# Altium project USRP-sdr.PrjPcb
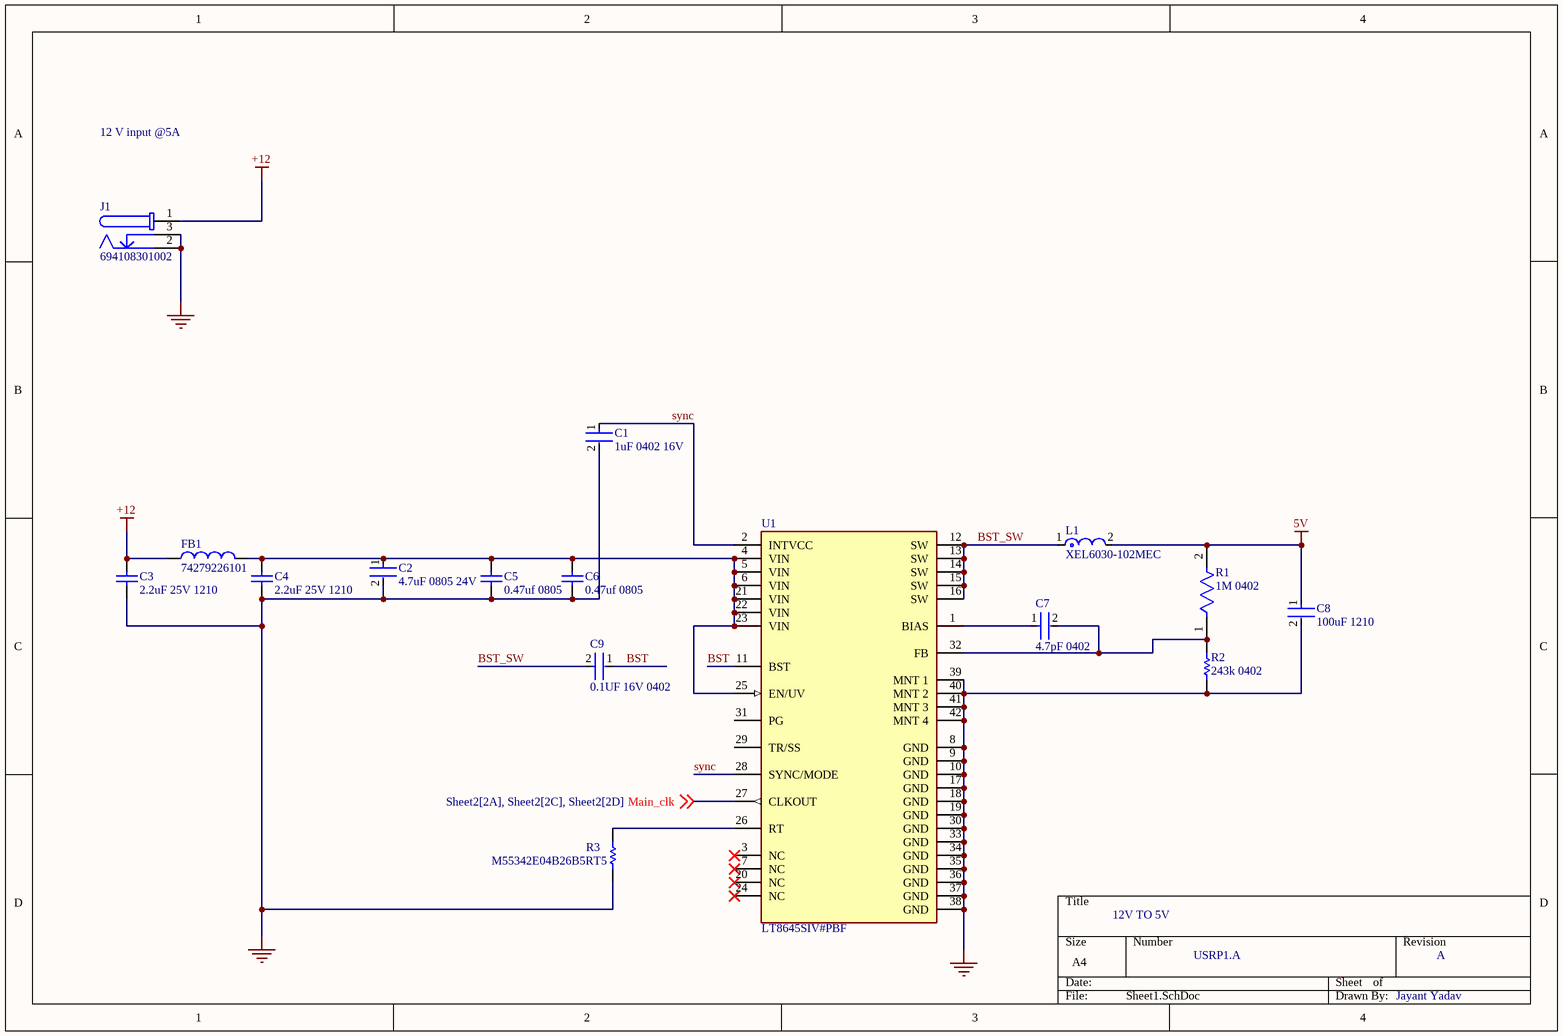
[diagram p0: Sheet1.SchDoc]
4 sheets, 190 parts. Net scope: flat (ports and power ports of the same name join across sheets).
Board file: PCB1.PcbDoc
Sheets:
  Sheet1.SchDoc
  Sheet2.SchDoc
  Sheet3.SchDoc
  Eth_2_5Gbe.SchDoc

## Sheet Sheet1.SchDoc
size A4; SheetNumber: 1; SheetTotal: 4

### Parts
C1  1uF 0402 16V  [FP-CC0402-MFG]
C2  4.7uF 0805 24V  [FP-C0805C475K3RACAUTO-MFG]
C3  2.2uF 25V 1210  [CAPC1210(3225)210_M]
C4  2.2uF 25V 1210  [CAPC1210(3225)210_M]
C5  0.47uf 0805  [CAPC2013X145X50NL20T25]
C6  0.47uf 0805  [CAPC2013X145X50NL20T25]
C7  4.7pF 0402  [FP-C0402-BB-MFG]
C8  100uF 1210  [FP-C1210C-FS-MFG]
C9  0.1UF 16V 0402  [FP-CC0402-0_05-0_55-L2_0-MFG]
FB1  74279226101  [WE-MPSB_1812_L4.5W3.2H2.3]
J1  694108301002  [694108301002]
L1  XEL6030-102MEC  [FP-XEL6030-3_1-MFG]
R1  1M 0402  [FP-MCS0402-IPC_C]
R2  243k 0402  [RESC1005X40X25NL05T05]
R3  M55342E04B26B5RT5  [RESC1005X40X25ML10T10]
U1  LT8645SIV#PBF  [FP-LQFN-32-05-08-1512-MFG]

### Nets
5V: C8.1 L1.2 R1.2
+12: C3.2 FB1.1 J1.1
GND: C1.2 C2.2 C3.1 C4.1 C5.1 C6.1 C8.2 J1.2 J1.3 R2.1 R3.1 U1.8(GND) U1.9(GND) U1.10(GND) U1.17(GND) U1.18(GND) U1.19(GND) U1.30(GND) U1.33(GND) U1.34(GND) U1.35(GND) U1.36(GND) U1.37(GND) U1.38(GND) U1.39(MNT_1) U1.40(MNT_2) U1.41(MNT_3) U1.42(MNT_4)
BST: C9.1 U1.11(BST)
BST_SW: C9.2 L1.1 U1.12(SW) U1.13(SW) U1.14(SW) U1.15(SW) U1.16(SW)
Main_clk: U1.27(CLKOUT) ; off-sheet Main_clk
sync: C1.1 U1.2(INTVCC) U1.28(SYNC/MODE)
NetC2_1: C2.1 C4.2 C5.2 C6.2 FB1.2 U1.4(VIN) U1.5(VIN) U1.6(VIN) U1.21(VIN) U1.22(VIN) U1.23(VIN) U1.25(EN/UV)
NetC7_1: C7.1 U1.1(BIAS)
NetC7_2: C7.2 R1.1 R2.2 U1.32(FB)
NetR3_2: R3.2 U1.26(RT)

Not connected (* = marked no-connect by the designer): U1 3(NC)* 7(NC)* 20(NC)* 24(NC)* 29(TR/SS) 31(PG)

### Notes on the sheet
- 12 V input @5A
- 12V TO 5V
- USRP1.A
- A
- Jayant Yadav

### Library data of the parts
C1 = CMP-03422-000064-1: CC0402 1 uF X5R 10.00% 16 V; Manufacturer: YAGEO; Manufacturer Part Number: CC0402KPX5R7BB105; Tolerance: 0.1; Automotive Grade: NA; Material: Ceramic; Temperature Coefficient: 30ppm/°C; Footprint Url: http://www.yageo.com/exep/pages/download/literatures/UPY-C_GEN_24.pdf; Temperature Characteristic: X5R; Device Class L3: Ceramic Capacitors; Category: Cap; ComponentLink2URL: http://www.yageo.com/documents/recent/UPY-GP_NP0_16V-to-50V_16.pdf; Voltage Rating: 16 V; Temperature Range Low: -55°C; Ipc Land Pattern Name: CAPC10050X50; Height: 0.55mm; Temperature: -55°C to +125°C; Automotive: No; Lead Free: Yes; Device Class L2: Capacitors; Device Class L1: Passive Components; Value: 1 uF; Temperature Range High: +125°C; Octopart: https://octopart.com/cc0402kpx5r7bb105-yageo-89998189; Capacitance: 1 uF; ComponentLink2Description: Datasheet; Package: CC0402; RoHS: TRUE
C2 = CMP-03020-034682-1: CAP CER 0805 4.7UF 25V X7R  10%; RoHS Compliant: Yes
C3 C4 = CMP-1038-02085-1: CAP 2.2uF 25V ±5% 1210 (3225 Metric) Thickness 2.05mm SMD; Case-Metric: 3225; Case-EIA: 1210; Tolerance: Â±5%; Technology: SMT; Max Thickness: 2.05 mm; Value: 2.2uF; Rated Voltage: 25 V
C5 C6 = CMP-2007-01148-1: Part Number: C0805C474K3RALTU; Manufacturer: Kemet
C7 = CMP-03020-005498-1: C0402 4.7 pF C0G 0.1 pF 50 V; Manufacturer: Kemet; Manufacturer Part Number: C0402C479B5GACAUTO; Tolerance: 0.1 pF; Temperature Coefficient: 15%; Material: Ceramic; Voltage Rating: 50 V; Temperature Range High: +125°C; Device Class L2: Capacitors; Package: C0402-BB; Temperature Range Low: -55°C; Capacitance: 4.7 pF; Category: Cap; RoHS: TRUE; ComponentLink2URL: https://content.kemet.com/datasheets/KEM_C1002_X7R_SMD.pdf; Height: 0.55mm; Lead Free: Yes; Mouser Description: Cap Ceramic 4.7pF 50V C0G 0.1pF SMD 0402 125°C T/R; Octopart: https://octopart.com/c0402c479b5gacauto-kemet-87334100; Value: 4.7 pF; Automotive: No; Device Class L3: Ceramic Capacitors; Ipc Land Pattern Name: CAPC10050X50; Temperature Characteristic: C0G; Device Class L1: Passive Components; Temperature: -55°C to +125°C; ComponentLink2Description: Datasheet
C8 = CMP-03020-034653-1: CAP CER 100UF 16V X5R 1210; Tolerance: 20%; Dielectric Material: Ceramic; Max Operating Temperature: 85°C; REACH SVHC: No SVHC; Case Code (Metric): 3225; Case/Package: 1210; Thickness: 0.106inch; Length: 3.2mm; Min Operating Temperature: -55°C; Voltage Rating (DC): 16V; Weight: 0.000564oz; Packaging: Tape and Reel; Case Code (Imperial): 1210; Depth: 2.5mm; Lead Free: Lead Free; Width: 0.098inch; Voltage Rating: 16V; Capacitance: 100uF; Termination: SMD/SMT; Dielectric: X5R; Package Quantity: 1000
C9 = CMP-03422-001485-1: CAP CER 0.1UF 16V X7R 0402; Tolerance: 5%; Capacitance: 100nF; Lead Free: Lead Free; Halogen Free: Halogen Free; Voltage Rating (DC): 16V; Thickness: 0.022inch; Resistor Type: Ceramic; Min Operating Temperature: -55°C; Width: 0.02inch; Voltage Rating: 16V; Package Quantity: 10000; Case/Package: 0402; Height: 0.5mm; Dielectric: X7R; Length: 1mm; Construction: Flat; Radiation Hardening: No; Case Code (Metric): 1005; Case Code (Imperial): 0402; Series: CC; Depth: 0.5mm; RoHS Compliant: Yes; Packaging: Tape and Reel; Mount: Surface Mount; Max Operating Temperature: 125°C
FB1 = CMP-1395-00002-2: NexarPartId: 21273894; Test Frequency: 100MHz; Impedance: 100Ω; Material: Ferrite, Steel; Max Current Rating: 8A; Frequency: 1.1GHz; Number of Lines: 1; DC Resistance (DCR): 4.5mΩ; Tolerance: 25%; Case Code (Metric): 4532; Mount: Surface Mount; Case Code (Imperial): 1812; Lead Free: Lead Free; Height: 2.3mm; Current Rating: 8A; Case/Package: 1812; Termination: SMD/SMT; REACH SVHC: Unknown; Max Operating Temperature: 125°C; Width: 3.2mm; Packaging: Digi-Reel®; Max DC Current: 8A; Min Operating Temperature: -55°C; RoHS: Compliant; Length: 4.5mm; Depth: 3.2mm
J1 = CMP-1502-00190-4: DC Power Jack Connector WR-DC, Male, Right Angled, THT, 5 A, 24 V; Operating Supply Voltage: 24V; Shielding: Unshielded; Voltage Rating: 30V; Number of Contacts: 3; Insulation Resistance: 100MΩ; Current Rating: 5A; Min Operating Temperature: -40°C; Packaging: Bulk; Connector Type: Power; Housing Material: Polyamide; REACH SVHC: Unknown; Termination: Through Hole; Contact Gender: Female; Mount: Through Hole; RoHS: Compliant; Flammability Rating: UL94 V-0; Height: 11mm; Max Operating Temperature: 85°C; Contact Plating: Tin; Color: Black; Gender: Male; Contact Material: Gold, Tin
L1 = CMP-11268-000097-1: Fixed Inductor 1uH Shld 20% 16A 6.95mOhms AECQ2; RoHS Compliant: Yes
R1 = CMP-02407-000443-1: RES SMD 1.2K OHM 1% 1/10W 0402; Voltage Rating (DC): 50V; Temperature Coefficient: 50ppm/°C; Resistance: 1MR; Power Rating: 63mW; Max Power Dissipation: 100mW; Radiation Hardening: No; Tolerance: 1%; Packaging: Tape and Reel; Case/Package: 0402; Case Code (Imperial): 0402; Width: 0.5mm; Lead Free: Lead Free; Composition: Thin Film; Mount: Surface Mount; Weight: 2.1E-05oz; Number of Terminations: 2; REACH SVHC: No SVHC; Depth: 0.5mm; Min Operating Temperature: -55°C; Height: 0.015inch; Max Operating Temperature: 125°C; Case Code (Metric): 1005; Package Quantity: 1; Military Standard: Not; Voltage Rating: 50V; Contact Plating: Tin; Length: 1mm
R2 = CMP-2002-08399-1: Manufacturer: Vishay Dale; Part Number: CRCW0402243KFKED
R3 = CMP-2002-05709-1: Manufacturer: TE Connectivity / AMP; Part Number: CRG0402F20K
U1 = CMP-09139-000710-1: IC REG BUCK ADJUSTABLE 8A 32LQFN; Output Voltage: 25V; Switching Frequency: 2.2MHz; Min Input Voltage: 3.4V; Max Input Voltage: 65V; Number of Outputs: 1; Quiescent Current: 400uA; Number of Pins: 32; Packaging: Rail/Tube; Min Supply Voltage: 3.4V; Package Quantity: 490; Output Current: 8A; Series: LT8645S; Max Operating Temperature: 125°C; RoHS Compliant: Yes; Min Operating Temperature: -40°C

## Sheet Sheet2.SchDoc: LM61460 Main Rail
size A3; DrawnBy: Jayant Yadav; SheetNumber: 2; SheetTotal: 4
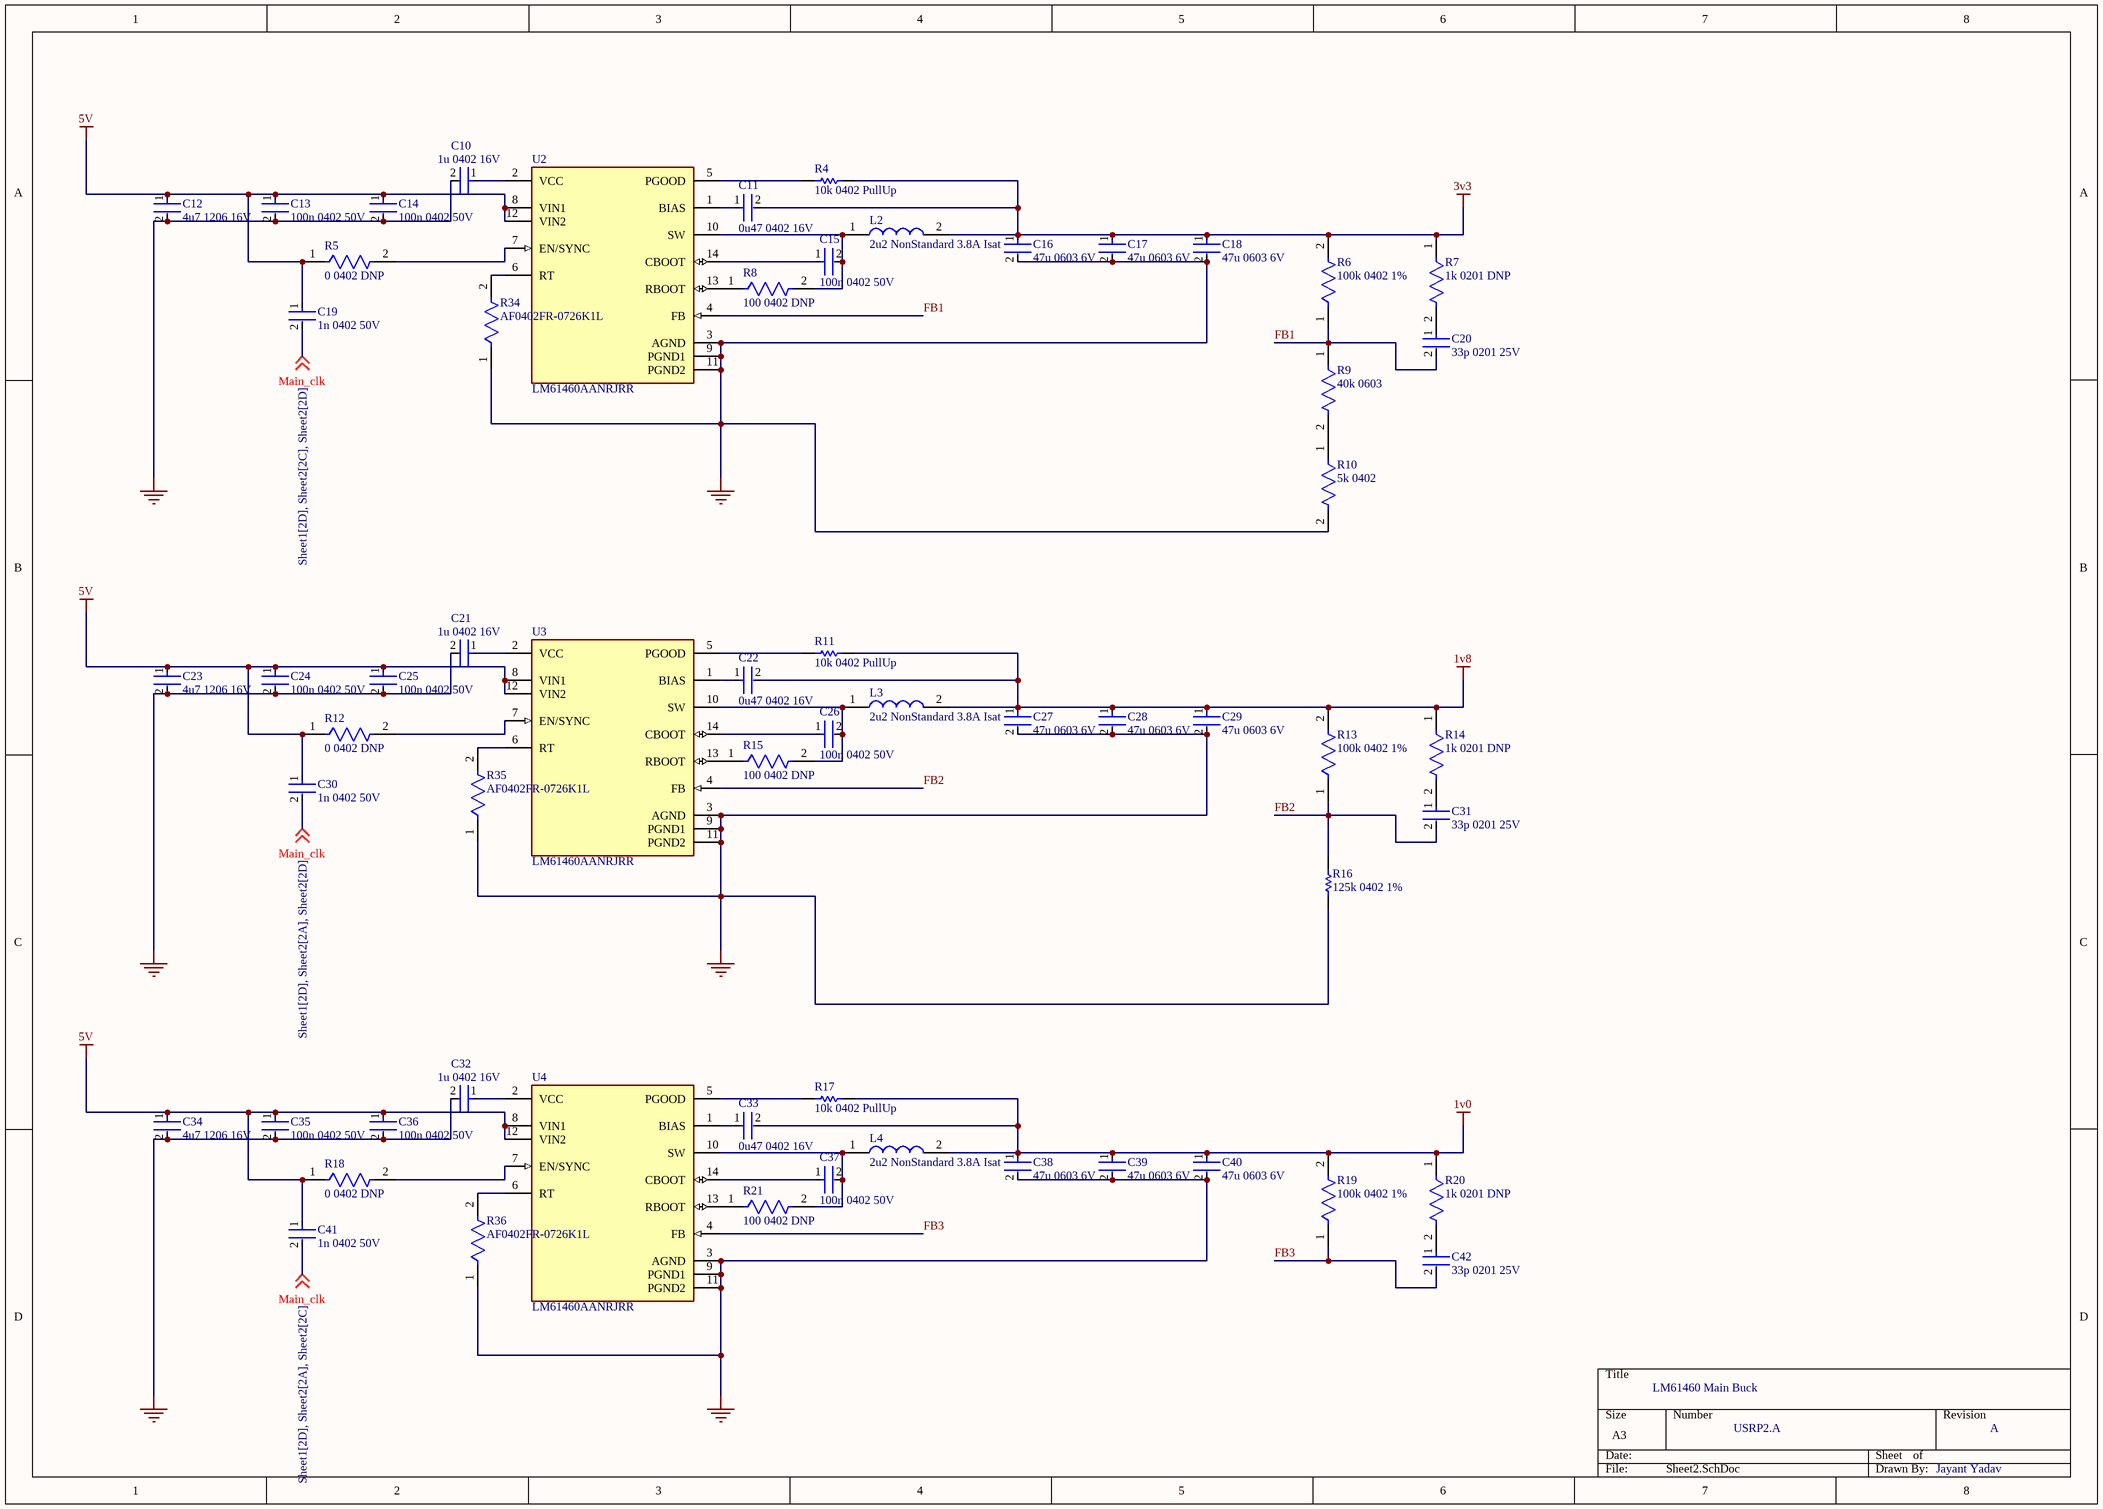
[diagram p1: Sheet2.SchDoc]

### Parts
C10  1u 0402 16V  [FP-CC0402-MFG]
C11  0u47 0402 16V  [FP-CC0402-CB-MFG]
C12  4u7 1206 16V  [FP-C3216-160-0_2-IPC_B]
C13  100n 0402 50V  [FP-0402B104K500CT-IPC_C]
C14  100n 0402 50V  [FP-0402B104K500CT-IPC_C]
C15  100n 0402 50V  [FP-0402B104K500CT-IPC_C]
C16  47u 0603 6V  [FP-GRM188-0_2-IPC_B]
C17  47u 0603 6V  [FP-GRM188-0_2-IPC_B]
C18  47u 0603 6V  [FP-GRM188-0_2-IPC_B]
C19  1n 0402 50V  [FP-0402B104K500CT-IPC_C]
C20  33p 0201 25V  [FP-C0201-AB-MFG]
C21  1u 0402 16V  [FP-CC0402-MFG]
C22  0u47 0402 16V  [FP-CC0402-CB-MFG]
C23  4u7 1206 16V  [FP-C3216-160-0_2-IPC_B]
C24  100n 0402 50V  [FP-0402B104K500CT-IPC_C]
C25  100n 0402 50V  [FP-0402B104K500CT-IPC_C]
C26  100n 0402 50V  [FP-0402B104K500CT-IPC_C]
C27  47u 0603 6V  [FP-GRM188-0_2-IPC_B]
C28  47u 0603 6V  [FP-GRM188-0_2-IPC_B]
C29  47u 0603 6V  [FP-GRM188-0_2-IPC_B]
C30  1n 0402 50V  [FP-0402B104K500CT-IPC_C]
C31  33p 0201 25V  [FP-C0201-AB-MFG]
C32  1u 0402 16V  [FP-CC0402-MFG]
C33  0u47 0402 16V  [FP-CC0402-CB-MFG]
C34  4u7 1206 16V  [FP-C3216-160-0_2-IPC_B]
C35  100n 0402 50V  [FP-0402B104K500CT-IPC_C]
C36  100n 0402 50V  [FP-0402B104K500CT-IPC_C]
C37  100n 0402 50V  [FP-0402B104K500CT-IPC_C]
C38  47u 0603 6V  [FP-GRM188-0_2-IPC_B]
C39  47u 0603 6V  [FP-GRM188-0_2-IPC_B]
C40  47u 0603 6V  [FP-GRM188-0_2-IPC_B]
C41  1n 0402 50V  [FP-0402B104K500CT-IPC_C]
C42  33p 0201 25V  [FP-C0201-AB-MFG]
L2  2u2 NonStandard 3.8A Isat  [SRP4020FA2R2M]
L3  2u2 NonStandard 3.8A Isat  [SRP4020FA2R2M]
L4  2u2 NonStandard 3.8A Isat  [SRP4020FA2R2M]
R4  10k 0402 PullUp  [RESC1005X40X20NL05T10]
R5  0 0402 DNP  [FP-CRCW0402-e3-IPC_C]
R6  100k 0402 1%  [FP-CRGCQ0402-IPC_C]
R7  1k 0201 DNP  [FP-AF0201-IPC_B]
R8  100 0402 DNP  [FP-AC0402-MFG]
R9  40k 0603  [FP-AT0603-IPC_B]
R10  5k 0402  [FP-PNM0402-IPC_C]
R11  10k 0402 PullUp  [RESC1005X40X20NL05T10]
R12  0 0402 DNP  [FP-CRCW0402-e3-IPC_C]
R13  100k 0402 1%  [FP-CRGCQ0402-IPC_C]
R14  1k 0201 DNP  [FP-AF0201-IPC_B]
R15  100 0402 DNP  [FP-AC0402-MFG]
R16  125k 0402 1%  [RESC1005X40X25NL10T10]
R17  10k 0402 PullUp  [RESC1005X40X20NL05T10]
R18  0 0402 DNP  [FP-CRCW0402-e3-IPC_C]
R19  100k 0402 1%  [FP-CRGCQ0402-IPC_C]
R20  1k 0201 DNP  [FP-AF0201-IPC_B]
R21  100 0402 DNP  [FP-AC0402-MFG]
R34  AF0402FR-0726K1L  [FP-AF0402-MFG]
R35  AF0402FR-0726K1L  [FP-AF0402-MFG]
R36  AF0402FR-0726K1L  [FP-AF0402-MFG]
U2  LM61460AANRJRR  [FP-RJR0014A-MFG]
U3  LM61460AANRJRR  [FP-RJR0014A-MFG]
U4  LM61460AANRJRR  [FP-RJR0014A-MFG]

### Nets
1v0: C33.2 C38.1 C39.1 C40.1 L4.2 R17.2 R19.2 R20.1
1v8: C22.2 C27.1 C28.1 C29.1 L3.2 R11.2 R13.2 R14.1
3v3: C11.2 C16.1 C17.1 C18.1 L2.2 R4.2 R6.2 R7.1
5V: C12.1 C13.1 C14.1 C19.1 C23.1 C24.1 C25.1 C30.1 C34.1 C35.1 C36.1 C41.1 R5.1 R12.1 R18.1 U2.8(VIN1) U2.12(VIN2) U3.8(VIN1) U3.12(VIN2) U4.8(VIN1) U4.12(VIN2)
GND: C10.2 C12.2 C13.2 C14.2 C16.2 C17.2 C18.2 C21.2 C23.2 C24.2 C25.2 C27.2 C28.2 C29.2 C32.2 C34.2 C35.2 C36.2 C38.2 C39.2 C40.2 R10.2 R16.1 R34.1 R35.1 R36.1 U2.3(AGND) U2.9(PGND1) U2.11(PGND2) U3.3(AGND) U3.9(PGND1) U3.11(PGND2) U4.3(AGND) U4.9(PGND1) U4.11(PGND2)
FB1: C20.2 R6.1 R9.1 U2.4(FB)
FB2: C31.2 R13.1 R16.2 U3.4(FB)
FB3: C42.2 R19.1 U4.4(FB)
Main_clk: C19.2 C30.2 C41.2 ; off-sheet Main_clk
NetC10_1: C10.1 U2.2(VCC)
NetC11_1: C11.1 U2.1(BIAS)
NetC15_1: C15.1 U2.14(CBOOT)
NetC15_2: C15.2 L2.1 R8.2 U2.10(SW)
NetC20_1: C20.1 R7.2
NetC21_1: C21.1 U3.2(VCC)
NetC22_1: C22.1 U3.1(BIAS)
NetC26_1: C26.1 U3.14(CBOOT)
NetC26_2: C26.2 L3.1 R15.2 U3.10(SW)
NetC31_1: C31.1 R14.2
NetC32_1: C32.1 U4.2(VCC)
NetC33_1: C33.1 U4.1(BIAS)
NetC37_1: C37.1 U4.14(CBOOT)
NetC37_2: C37.2 L4.1 R21.2 U4.10(SW)
NetC42_1: C42.1 R20.2
NetR4_1: R4.1 U2.5(PGOOD)
NetR5_2: R5.2 U2.7(EN/SYNC)
NetR8_1: R8.1 U2.13(RBOOT)
NetR9_2: R9.2 R10.1
NetR11_1: R11.1 U3.5(PGOOD)
NetR12_2: R12.2 U3.7(EN/SYNC)
NetR15_1: R15.1 U3.13(RBOOT)
NetR17_1: R17.1 U4.5(PGOOD)
NetR18_2: R18.2 U4.7(EN/SYNC)
NetR21_1: R21.1 U4.13(RBOOT)
NetR34_2: R34.2 U2.6(RT)
NetR35_2: R35.2 U3.6(RT)
NetR36_2: R36.2 U4.6(RT)

### Notes on the sheet
- LM61460 Main Buck
- USRP2.A
- A
- Jayant Yadav

### Library data of the parts
C10 C21 C32 = CMP-03422-001191-1: CAP CER 1UF 16V X5R 0402; Manufacturer: YAGEO; Manufacturer Part Number: CC0402KRX5R7BB105; Automotive Grade: NA; Material: Ceramic; Tolerance: 0.1; Temperature Coefficient: 30ppm/°C; Octopart: https://octopart.com/cc0402krx5r7bb105-yageo-25629500; Digikey Description: CAP CER 1UF 16V X5R 0402; ComponentLink2URL: http://www.yageo.com/documents/recent/UPY-GP_NP0_16V-to-50V_16.pdf; Lead Free: Yes; Ipc Land Pattern Name: CAPC10050X50; Device Class L3: Ceramic Capacitors; Capacitance: 1 uF; Automotive: No; Device Class L2: Capacitors; Package: CC0402; Footprint Url: http://www.yageo.com/exep/pages/download/literatures/UPY-C_GEN_24.pdf; Temperature Range Low: -55°C; Value: 1 uF; Temperature Range High: +125°C; Height: 0.55mm; Category: Cap; ComponentLink2Description: Datasheet; Temperature Characteristic: X5R; Voltage Rating: 16 V; Mouser Description: 0402 1 uF 16 V ±10% Tolerance X5R Multilayer Ceramic Chip Capacitor; Temperature: -55°C to +125°C; Device Class L1: Passive Components; RoHS: TRUE
C11 C22 C33 = CMP-03422-000370-2: CAP CER 0.47UF 16V X5R 0402; Tolerance: 10%; Capacitance: 470nF; Halogen Free: Halogen Free; Case/Package: 0402; Mount: Surface Mount; Lead Free: Lead Free; Packaging: Tape and Reel; Width: 0.02inch; Voltage Rating (DC): 16V; Thickness: 0.022inch; Max Operating Temperature: 85°C; Length: 0.039inch; Voltage Rating: 16V; Min Operating Temperature: -55°C; RoHS Compliant: Yes
C12 C23 C34 = CMP-08246-006479-1: Multilayer Ceramic Capacitors 4.7uF ±20% 16V X7R SMD 1206; Voltage Rating (DC): 16V; Weight: 0.000571oz; RoHS Compliant: Yes; Case Code (Imperial): 1206; Series: C; Mount: Surface Mount; Case/Package: 1206; Height: 1.6mm; Case Code (Metric): 3216; Voltage Rating: 16V; Number of Pins: 2; Termination: SMD/SMT; Resistor Type: Ceramic; Capacitance: 4.7uF; Length: 0.126inch; Max Operating Temperature: 125°C; Packaging: Tape and Reel; Tolerance: 20%; Dielectric: X7R; Thickness: 0.071inch; Width: 0.063inch; Package Quantity: 1; Min Operating Temperature: -55°C; Features: Soft Termination; Depth: 1.6mm
C13-C15 C19 C24-C26 C30 C35-C37 C41 = CMP-45632-000010-1: CAP CER 0.1UF 50V X7R 0402; Tolerance: 10%; Capacitance: 100nF; Max Operating Temperature: 125°C; Case Code (Metric): 1005; RoHS Compliant: Yes; Series: -; Case Code (Imperial): 0402; Voltage Rating: 50V; Min Operating Temperature: -55°C; Mount: Surface Mount; Case/Package: 0402; Packaging: Cut Tape
C16-C18 C27-C29 C38-C40 = CMP-2000-05444-2: Chip Multilayer Ceramic Capacitors for General Purpose, 0603, 47uF, X5R, 15%, 20%, 6.3V; Voltage Rating (DC): 6.3V; Thickness: 0.039inch; Case Code (Imperial): 0603; Packaging: Tape and Reel; Capacitance: 47uF; Width: 0.031inch; Dielectric: X5R; Max Operating Temperature: 85°C; Mount: Surface Mount; Case Code (Metric): 1608; Length: 0.063inch; Voltage Rating: 6.3V; Tolerance: 20%; Case/Package: 0603; Min Operating Temperature: -55°C
C20 C31 C42 = CMP-03020-011228-1: CAP CER 33PF 25V 5% NP0 0201; Manufacturer: KEMET; Manufacturer Part Number: C0201C330J3GACTU; Temperature Characteristic: C0G; Standoff Height: 0mm; Material: Ceramic; Temperature Coefficient: 30ppm/°C; Tolerance: 0.05; Voltage Rating: 25 V; Temperature Range Low: -55°C; Ipc Land Pattern Name: CAPC6030X30; Capacitance: 33 pF; ComponentLink2URL: https://content.kemet.com/datasheets/KEM_C1003_C0G_SMD.pdf; Automotive: No; Package: C0201-AB; Temperature: -55°C to +125°C; Height: 0.33mm; Digikey Description: CAP CER 33PF 25V 5% NP0 0201; Device Class L3: Ceramic Capacitors; Device Class L1: Passive Components; Device Class L2: Capacitors; Octopart: https://octopart.com/c0201c330j3gactu-kemet-16237019; Temperature Range High: +125°C; RoHS: TRUE; Category: Cap; Lead Free: Yes; ComponentLink2Description: Datasheet; Value: 33 pF; Mouser Description: Multilayer Ceramic Capacitors MLCC - SMD/SMT 25volts 33pF C0G 5%
L2-L4 = SRP4020FA-2R2M: Inductor; Manufacturer_Name: Bourns; Datasheet Link: https://www.bourns.com/docs/Product-Datasheets/SRP4020FA.pdf; Height: 2.1mm; Manufacturer_Part_Number: SRP4020FA-2R2M; Mouser Part Number: 652-SRP4020FA-2R2M; Mouser Price/Stock: https://www.mouser.co.uk/ProductDetail/Bourns/SRP4020FA-2R2M?qs=MLItCLRbWswKB3debRJXpA%3D%3D; Arrow Part Number: SRP4020FA-2R2M; Arrow Price/Stock: https://www.arrow.com/en/products/srp4020fa-2r2m/bourns.html?utm_currency=USD&region=nac
R4 R11 R17 = CMP-2002-01682-1: Manufacturer: Vishay BCcomponents; Part Number: TNPW040210K0DEED
R5 R12 R18 = CMP-2002-08122-2: RES Thick Film, 0Ω, 0.063W, 0402; Tolerance: 5%; Max Power Dissipation: 63mW; Voltage Rating: 50V; Temperature Coefficient: 100ppm/°C; Resistance: 0mR; Contact Plating: Tin; Height: 0.35mm; Radiation Hardening: No; Features: Automotive AEC-Q200; Composition: Thick Film; Width: 0.5mm; Weight: 2.3E-05oz; Termination: SMD/SMT; Packaging: Tape and Reel; Mount: Surface Mount; Case Code (Metric): 1005; Military Standard: Not; Min Operating Temperature: -55°C; Number of Terminations: 2; Package Quantity: 1; Case Code (Imperial): 0402; Depth: 0.5mm; Max Operating Temperature: 155°C; Case/Package: 0402; Power Rating: 63mW; Lead Free: Lead Free; Voltage Rating (DC): 50V; Length: 1mm
R6 R13 R19 = CMP-03211-001412-1: CRGCQ0402 100KΩ 1% ±100ppm/°C 50V; Manufacturer Part Number: CRGCQ0402F100K; Manufacturer: TE Connectivity; Tolerance: 0.01; Power Rating: 0.0625W; Resistance: 100KΩ; Ambient Temperature Range High: +70°C; Series: CRGCQ; Temperature: -55°C to +155°C; Temperature Range Low: -55°C; ComponentLink2Description: Datasheet; Category: Res; Temperature Range High: +155°C; Automotive: Yes; Device Class L2: Resistors; Height: 0.4mm; Ipc Land Pattern Name: RESC10050X35; Voltage Rating: 50V; ComponentLink2URL: https://www.te.com/commerce/DocumentDelivery/DDEController?Action=showdoc&DocId=Data+Sheet%7F1773204-3%7F1%7Fpdf%7FEnglish%7FENG_DS_1773204-3_1.pdf%7F4-2176347-1150; Composition: Thick Film; Device Class L1: Passive Components; Device Class L3: Chip SMD Resistors; RoHS: TRUE; Temperature Coefficient: ±100ppm/°C; Lead Free: Yes; Value: 100KΩ; Octopart: https://octopart.com/crgcq0402f100k-te+connectivity-91017930; Package: CRGCQ0402
R7 R14 R20 = CMP-03412-042796-1: Anti-Sulfurated Chip Resistors Automotive Grade 1kΩ 1% 200ppm/°C 0201; Max Power Dissipation: 50mW; Resistance: 1kR; Case/Package: 0201; Length: 0.024inch; Tolerance: 1%; Width: 0.012inch; Height: 0.01inch; RoHS Compliant: Yes; Temperature Coefficient: 200ppm/°C; Max Operating Temperature: 125°C; Features: Moisture Resistant; Packaging: Tape and Reel; Resistor Type: Thick Film; Number of Terminations: 2; Min Operating Temperature: -55°C; Series: AF
R8 R15 R21 = CMP-03412-022855-2: RES 100Ω ±1% 0.063W 0402; Resistance: 100R; RoHS Compliant: Yes; Tolerance: 1%; Case/Package: 0402
R9 = CMP-03412-038922-1: Thin Film Chip Resistors Automotive Grade 40kΩ 0.1% 25ppm/°C 0603
R10 = CMP-02407-012302-1: RES SMD 5K OHM 0.1% 1/20W 0402; Temperature Coefficient: 25ppm/°C; Resistance: 5kR; Max Power Dissipation: 50mW; Width: 0.022inch; Height: 0.033inch; Tolerance: 0.1%; Number of Terminations: 2; Packaging: Tape and Reel; RoHS Compliant: Yes; Case Code (Imperial): 0402; Min Operating Temperature: -55°C; Case Code (Metric): 1005; Features: Moisture Resistant; Max Operating Temperature: 155°C; Package Quantity: 1000; Resistor Type: Thin Film; Length: 0.042inch; Case/Package: 0402
R16 = CMP-2002-06075-1: Manufacturer: Multicomp; Part Number: MC00625W0402125K5
R34-R36 = CMP-03412-040628-1: Anti-Sulfurated Chip Resistors Automotive Grade 26.1kΩ 1% 100ppm/°C 0402; Max Power Dissipation: 63mW; Resistance: 26.1kR; RoHS Compliant: Yes; Number of Terminations: 2; Width: 0.02inch; Temperature Coefficient: 100ppm/°C; Case/Package: 0402; Packaging: Tape and Reel; Height: 0.015inch; Length: 0.039inch; Max Operating Temperature: 155°C; Series: AF; Resistor Type: Thick Film; Features: Moisture Resistant; Min Operating Temperature: -55°C; Tolerance: 1%
U2-U4 = CMP-04918-000597-1: LM61460AAN PRODUCTION MATERIAL

## Sheet Sheet3.SchDoc
size A3; SheetNumber: 3; SheetTotal: 4
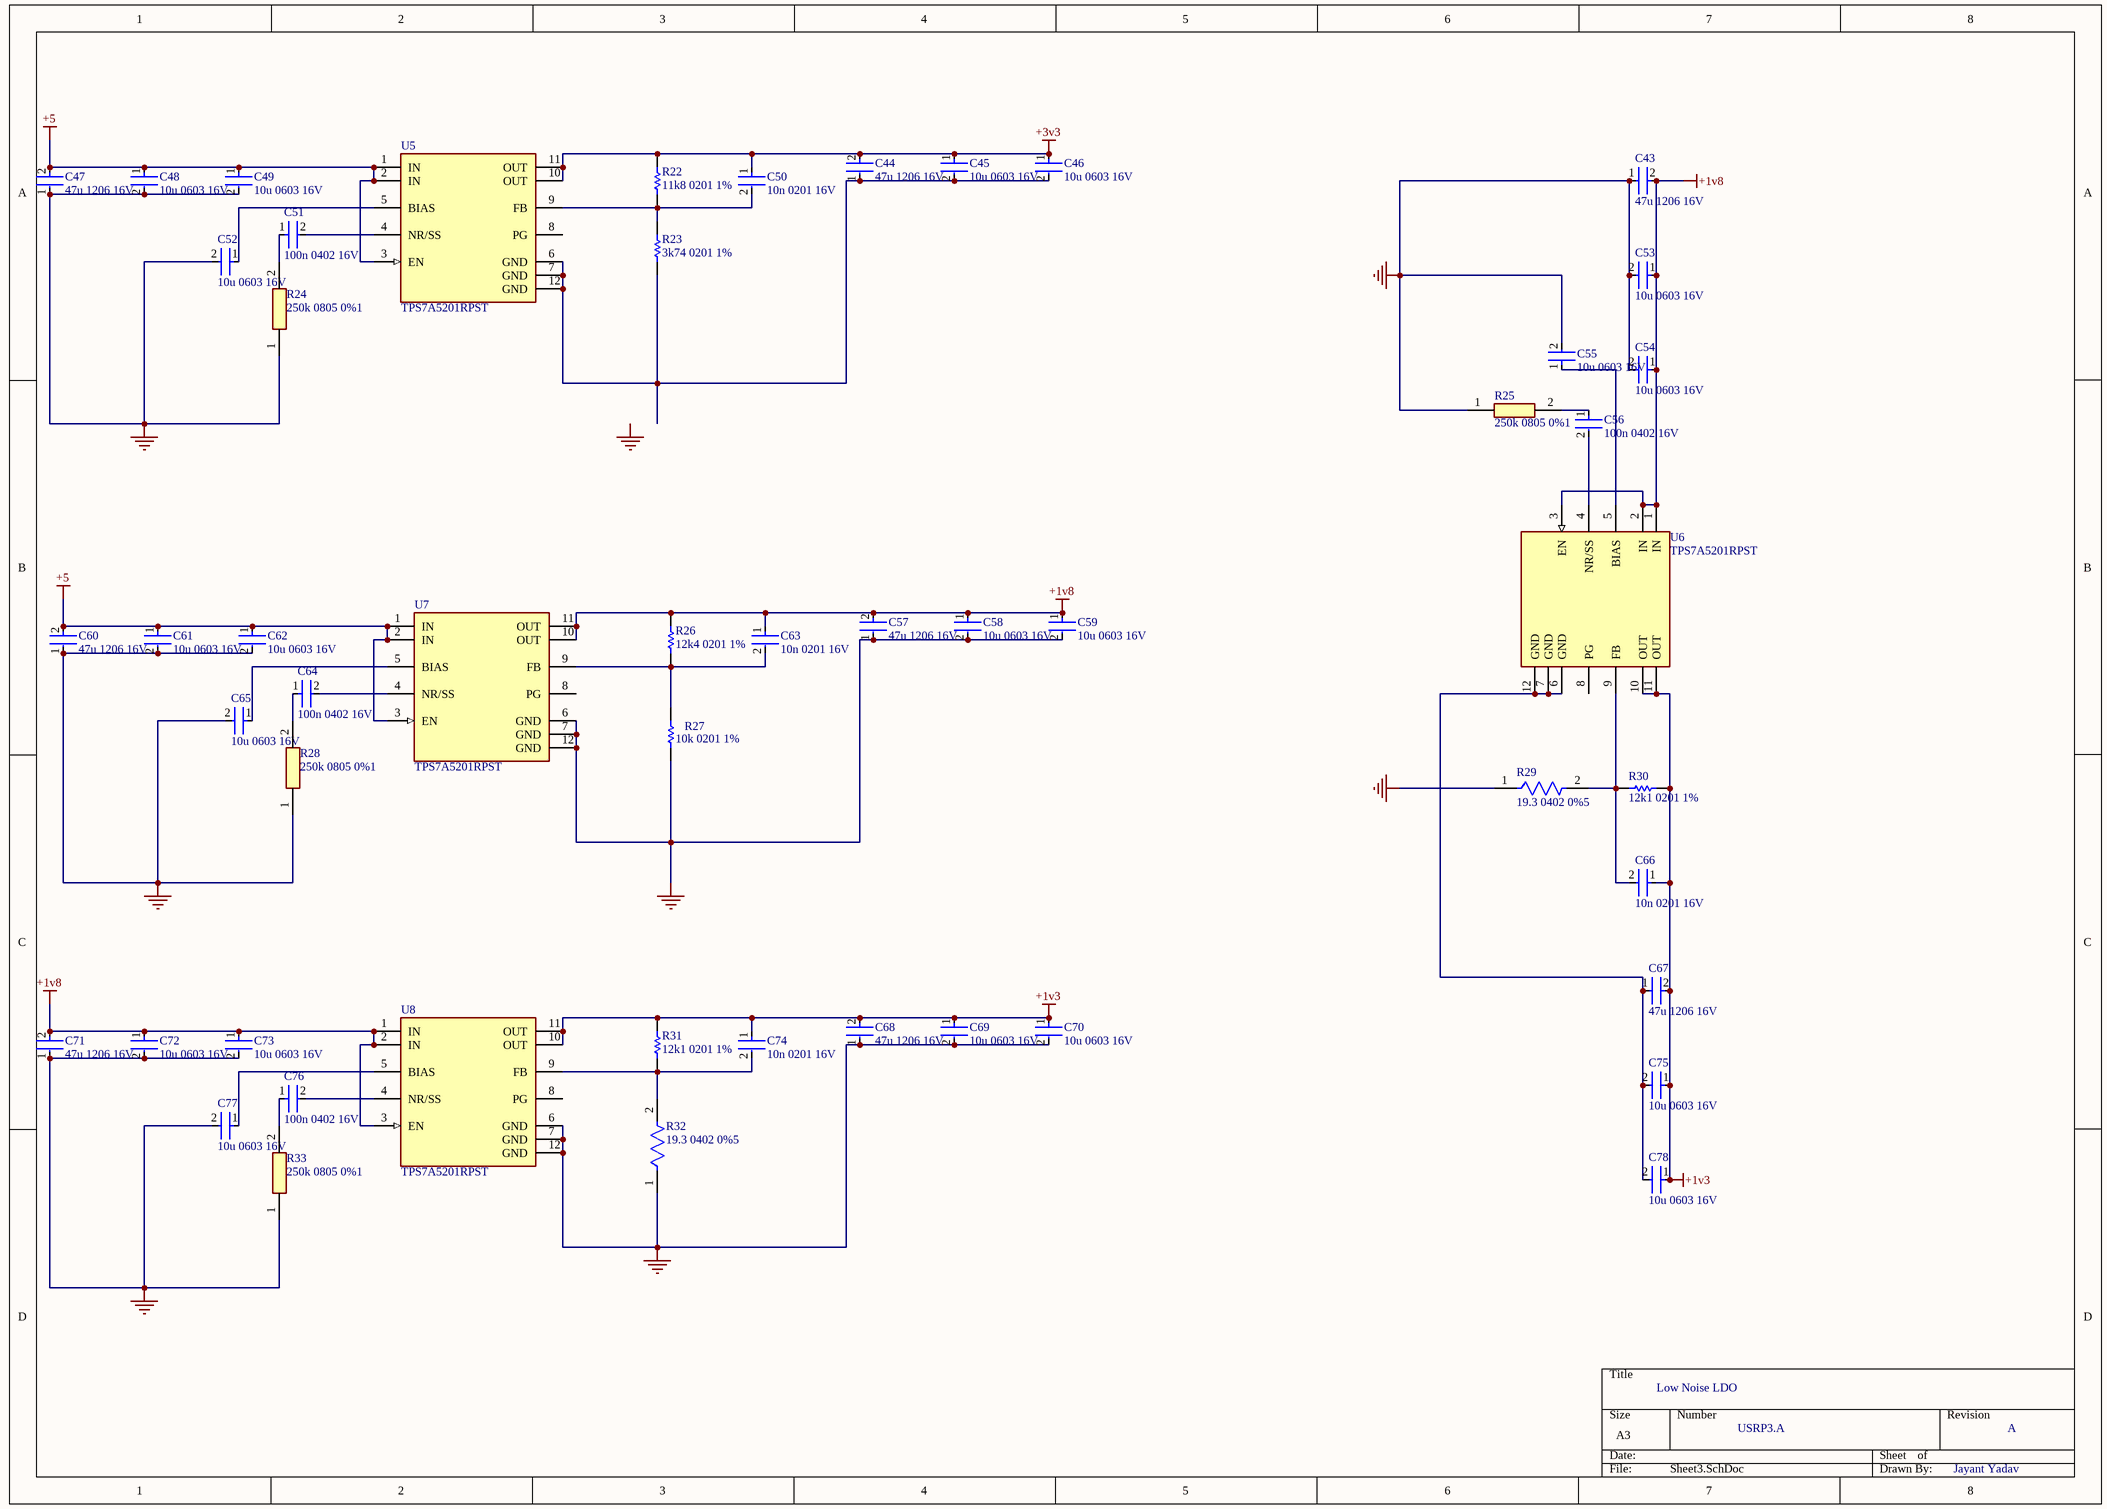
[diagram p2: Sheet3.SchDoc]

### Parts
C43  47u 1206 16V  [FP-GRM31C-0_3-e0_3_0_8-IPC_C]
C44  47u 1206 16V  [FP-GRM31C-0_3-e0_3_0_8-IPC_C]
C45  10u 0603 16V  [FP-CC0603-DC-MFG]
C46  10u 0603 16V  [FP-CC0603-DC-MFG]
C47  47u 1206 16V  [FP-GRM31C-0_3-e0_3_0_8-IPC_C]
C48  10u 0603 16V  [FP-CC0603-DC-MFG]
C49  10u 0603 16V  [FP-CC0603-DC-MFG]
C50  10n 0201 16V  [FP-CC0201-BA-MFG]
C51  100n 0402 16V  [FP-C0402-BB-MFG]
C52  10u 0603 16V  [FP-CC0603-DC-MFG]
C53  10u 0603 16V  [FP-CC0603-DC-MFG]
C54  10u 0603 16V  [FP-CC0603-DC-MFG]
C55  10u 0603 16V  [FP-CC0603-DC-MFG]
C56  100n 0402 16V  [FP-C0402-BB-MFG]
C57  47u 1206 16V  [FP-GRM31C-0_3-e0_3_0_8-IPC_C]
C58  10u 0603 16V  [FP-CC0603-DC-MFG]
C59  10u 0603 16V  [FP-CC0603-DC-MFG]
C60  47u 1206 16V  [FP-GRM31C-0_3-e0_3_0_8-IPC_C]
C61  10u 0603 16V  [FP-CC0603-DC-MFG]
C62  10u 0603 16V  [FP-CC0603-DC-MFG]
C63  10n 0201 16V  [FP-CC0201-BA-MFG]
C64  100n 0402 16V  [FP-C0402-BB-MFG]
C65  10u 0603 16V  [FP-CC0603-DC-MFG]
C66  10n 0201 16V  [FP-CC0201-BA-MFG]
C67  47u 1206 16V  [FP-GRM31C-0_3-e0_3_0_8-IPC_C]
C68  47u 1206 16V  [FP-GRM31C-0_3-e0_3_0_8-IPC_C]
C69  10u 0603 16V  [FP-CC0603-DC-MFG]
C70  10u 0603 16V  [FP-CC0603-DC-MFG]
C71  47u 1206 16V  [FP-GRM31C-0_3-e0_3_0_8-IPC_C]
C72  10u 0603 16V  [FP-CC0603-DC-MFG]
C73  10u 0603 16V  [FP-CC0603-DC-MFG]
C74  10n 0201 16V  [FP-CC0201-BA-MFG]
C75  10u 0603 16V  [FP-CC0603-DC-MFG]
C76  100n 0402 16V  [FP-C0402-BB-MFG]
C77  10u 0603 16V  [FP-CC0603-DC-MFG]
C78  10u 0603 16V  [FP-CC0603-DC-MFG]
R22  11k8 0201 1%  [RESC0603X28X15LL05T05]
R23  3k74 0201 1%  [RESC0603X28X15LL05T05]
R24  250k 0805 0%1  [RESC2012X65N]
R25  250k 0805 0%1  [RESC2012X65N]
R26  12k4 0201 1%  [RESC0603X26X15NL03T05]
R27  10k 0201 1%  [RESC0603X28X15LL05T05]
R28  250k 0805 0%1  [RESC2012X65N]
R29  19.3 0402 0%5  [FP-RN73R1E-IPC_B]
R30  12k1 0201 1%  [RESC0603X26X15NL03T05]
R31  12k1 0201 1%  [RESC0603X26X15NL03T05]
R32  19.3 0402 0%5  [FP-RN73R1E-IPC_B]
R33  250k 0805 0%1  [RESC2012X65N]
U5  TPS7A5201RPST  [FP-RPS0012A-MFG]
U6  TPS7A5201RPST  [FP-RPS0012A-MFG]
U7  TPS7A5201RPST  [FP-RPS0012A-MFG]
U8  TPS7A5201RPST  [FP-RPS0012A-MFG]

### Nets
+1v3: C66.1 C67.2 C68.2 C69.1 C70.1 C74.1 C75.1 C78.1 R30.2 R31.2 U6.10(OUT) U6.11(OUT) U8.10(OUT) U8.11(OUT)
+1v8: C43.2 C53.1 C54.1 C57.2 C58.1 C59.1 C63.1 C71.2 C72.1 C73.1 R26.2 U6.1(IN) U6.2(IN) U6.3(EN) U7.10(OUT) U7.11(OUT) U8.1(IN) U8.2(IN) U8.3(EN)
+3v3: C44.2 C45.1 C46.1 C50.1 R22.2 U5.10(OUT) U5.11(OUT)
+5: C47.2 C48.1 C49.1 C60.2 C61.1 C62.1 U5.1(IN) U5.2(IN) U5.3(EN) U7.1(IN) U7.2(IN) U7.3(EN)
GND: C43.1 C47.1 C48.2 C49.2 C52.2 C53.2 C54.2 C55.2 C57.1 C58.2 C59.2 C60.1 C61.2 C62.2 C65.2 C68.1 C69.2 C70.2 C71.1 C72.2 C73.2 C77.2 R24.1 R25.1 R27.1 R28.1 R29.1 R32.1 R33.1 U7.6(GND) U7.7(GND) U7.12(GND) U8.6(GND) U8.7(GND) U8.12(GND)
NetC44_1: C44.1 C45.2 C46.2 R23.1 U5.6(GND) U5.7(GND) U5.12(GND)
NetC50_2: C50.2 R22.1 R23.2 U5.9(FB)
NetC51_1: C51.1 R24.2
NetC51_2: C51.2 U5.4(NR/SS)
NetC52_1: C52.1 U5.5(BIAS)
NetC55_1: C55.1 U6.5(BIAS)
NetC56_1: C56.1 R25.2
NetC56_2: C56.2 U6.4(NR/SS)
NetC63_2: C63.2 R26.1 R27.2 U7.9(FB)
NetC64_1: C64.1 R28.2
NetC64_2: C64.2 U7.4(NR/SS)
NetC65_1: C65.1 U7.5(BIAS)
NetC66_2: C66.2 R29.2 R30.1 U6.9(FB)
NetC67_1: C67.1 C75.2 C78.2 U6.6(GND) U6.7(GND) U6.12(GND)
NetC74_2: C74.2 R31.1 R32.2 U8.9(FB)
NetC76_1: C76.1 R33.2
NetC76_2: C76.2 U8.4(NR/SS)
NetC77_1: C77.1 U8.5(BIAS)

Not connected (* = marked no-connect by the designer): U5 8(PG); U6 8(PG); U7 8(PG); U8 8(PG)

### Notes on the sheet
- Low Noise LDO
- USRP3.A
- A
- Jayant Yadav
- Labels drawn without touching a wire or pin: GND

### Library data of the parts
C43 C44 C47 C57 C60 C67 C68 C71 = CMP-06035-011430-1: Chip Multilayer Ceramic Capacitors for General Purpose, 1206, 47uF, X5R, 15%, 20%, 16V; Capacitance: 47uF; Length: 3.2mm; Thickness: 1.6mm; Width: 1.6mm; Voltage Rating (DC): 16V; Tolerance: 20%; Dielectric: X5R
C45 C46 C48 C49 C52-C55 C58 C59 C61 C62 C65 C69 C70 C72 C73 C75 C77 C78 = CMP-00621-81932632-1: CC0603KRX5R7BB106 Multilayer Ceramic Capacitor, 10 uF, 16 V, ± 10%, X5R, 0603 [1608 Metric]; Capacitance: 10µF; NexarPartId: 81932632; Height: 1mm; Halogen Free: Halogen Free; Voltage Rating: 16V; Dielectric: X5R; Max Operating Temperature: 85°C; Voltage Rating (DC): 16V; Material: Ceramic; Lead Free: Lead Free; Tolerance: 10%; RoHS: Non-Compliant; Min Operating Temperature: -55°C; Case/Package: 0603
C50 C63 C66 C74 = CMP-03422-000237-1: CAP CER 10000PF 16V X7R 0201; Manufacturer: Yageo; Manufacturer Part Number: CC0201KRX7R7BB103; Value: 10 nF; Material: Ceramic; Tolerance: 0.1; Temperature Coefficient: 15%; Ipc Land Pattern Name: CAPC6030X30; Footprint Url: http://www.yageo.com/exep/pages/download/literatures/UPY-C_GEN_24.pdf; Device Class L2: Capacitors; Mouser Description: Multilayer Ceramic Capacitors MLCC - SMD/SMT 10nF 16V X7R 10%; Octopart: https://octopart.com/cc0201krx7r7bb103-yageo-9292627; Temperature: -55°C to +85°C; Package: CC0201-BA; Capacitance: 10 nF; Device Class L1: Passive Components; Device Class L3: Ceramic Capacitors; Digikey Description: CAP CER 10000PF 16V X7R 0201; ComponentLink2URL: http://www.yageo.com/documents/recent/UPY-GPHC_X5R_4V-to-50V_25.pdf; Temperature Characteristic: X7R; Automotive: No; RoHS: TRUE; Voltage Rating: 16 V; Temperature Range Low: -55°C; Category: Cap; Height: 0.33mm; ComponentLink2Description: Datasheet; Temperature Range High: +85°C; Lead Free: Yes
C51 C56 C64 C76 = CMP-2008-03082-2: CAP CER 0.1UF 16V X7R 0402; Manufacturer Part Number: C0402C104K4RACAUTO; Manufacturer: Kemet; Temperature Coefficient: 15%; Tolerance: 0.1; Capacitance: 0.10 μF; Material: Ceramic; Value: 0.10 μF; Device Class L3: Ceramic Capacitors; Voltage Rating: 16 V; Temperature Range High: +125°C; Device Class L2: Capacitors; Height: 0.55mm; Category: Cap; RoHS: TRUE; Temperature Characteristic: X7R; Octopart: https://octopart.com/c0402c104k4racauto-kemet-17309149; Digikey Description: CAP CER 0.1UF 16V X7R 0402; Device Class L1: Passive Components; Temperature Range Low: -55°C; Mouser Description: Cap Ceramic 0.1uF 16V X7R 10% Pad SMD 0402 125C Automotive T/R; ComponentLink2Description: Datasheet; Automotive: No; Ipc Land Pattern Name: CAPC10050X50; ComponentLink2URL: https://content.kemet.com/datasheets/KEM_C1002_X7R_SMD.pdf; Lead Free: Yes; Temperature: -55°C to +125°C; Package: C0402-BB
R22 = CMP-2004-00049-1: Manufacturer: Vishay Dale; Part Number: CRCW020111K8FNED
R23 = CMP-2004-00570-1: Part Number: CRCW02013K74FNED; Manufacturer: Vishay Dale
R24 R25 R28 R33 = RNCF0805BTE250K: Resistor; Manufacturer_Name: Stackpole Electronics; Datasheet Link: https://www.seielect.com/catalog/sei-rncf.pdf; Height: 0.65mm; Manufacturer_Part_Number: RNCF0805BTE250K; Arrow Part Number: RNCF0805BTE250K; Arrow Price/Stock: https://www.arrow.com/en/products/rncf0805bte250k/stackpole-electronics?utm_currency=USD&region=nac
R26 = CMP-2004-03223-1: Manufacturer: Panasonic; Part Number: ERJ-1GNF1242C
R27 = CMP-2004-00016-1: Manufacturer: Vishay Dale; Part Number: CRCW020110K0FNED
R29 R32 = CMP-04015-035147-1: 19.3kΩ ±0.1% 0.063W, 1/16W Chip Resistor 0402 (1005 Metric) Moisture Resistant Thin Film
R30 R31 = CMP-1010-00538-2: Part Number: ERJ-1GNF1212C; Manufacturer: Panasonic
U5-U8 = CMP-04917-000343-1: IC REG LINEAR POS ADJ 2A 12VQFN

## Sheet Eth_2_5Gbe.SchDoc
size C; SheetNumber: 4; SheetTotal: 4
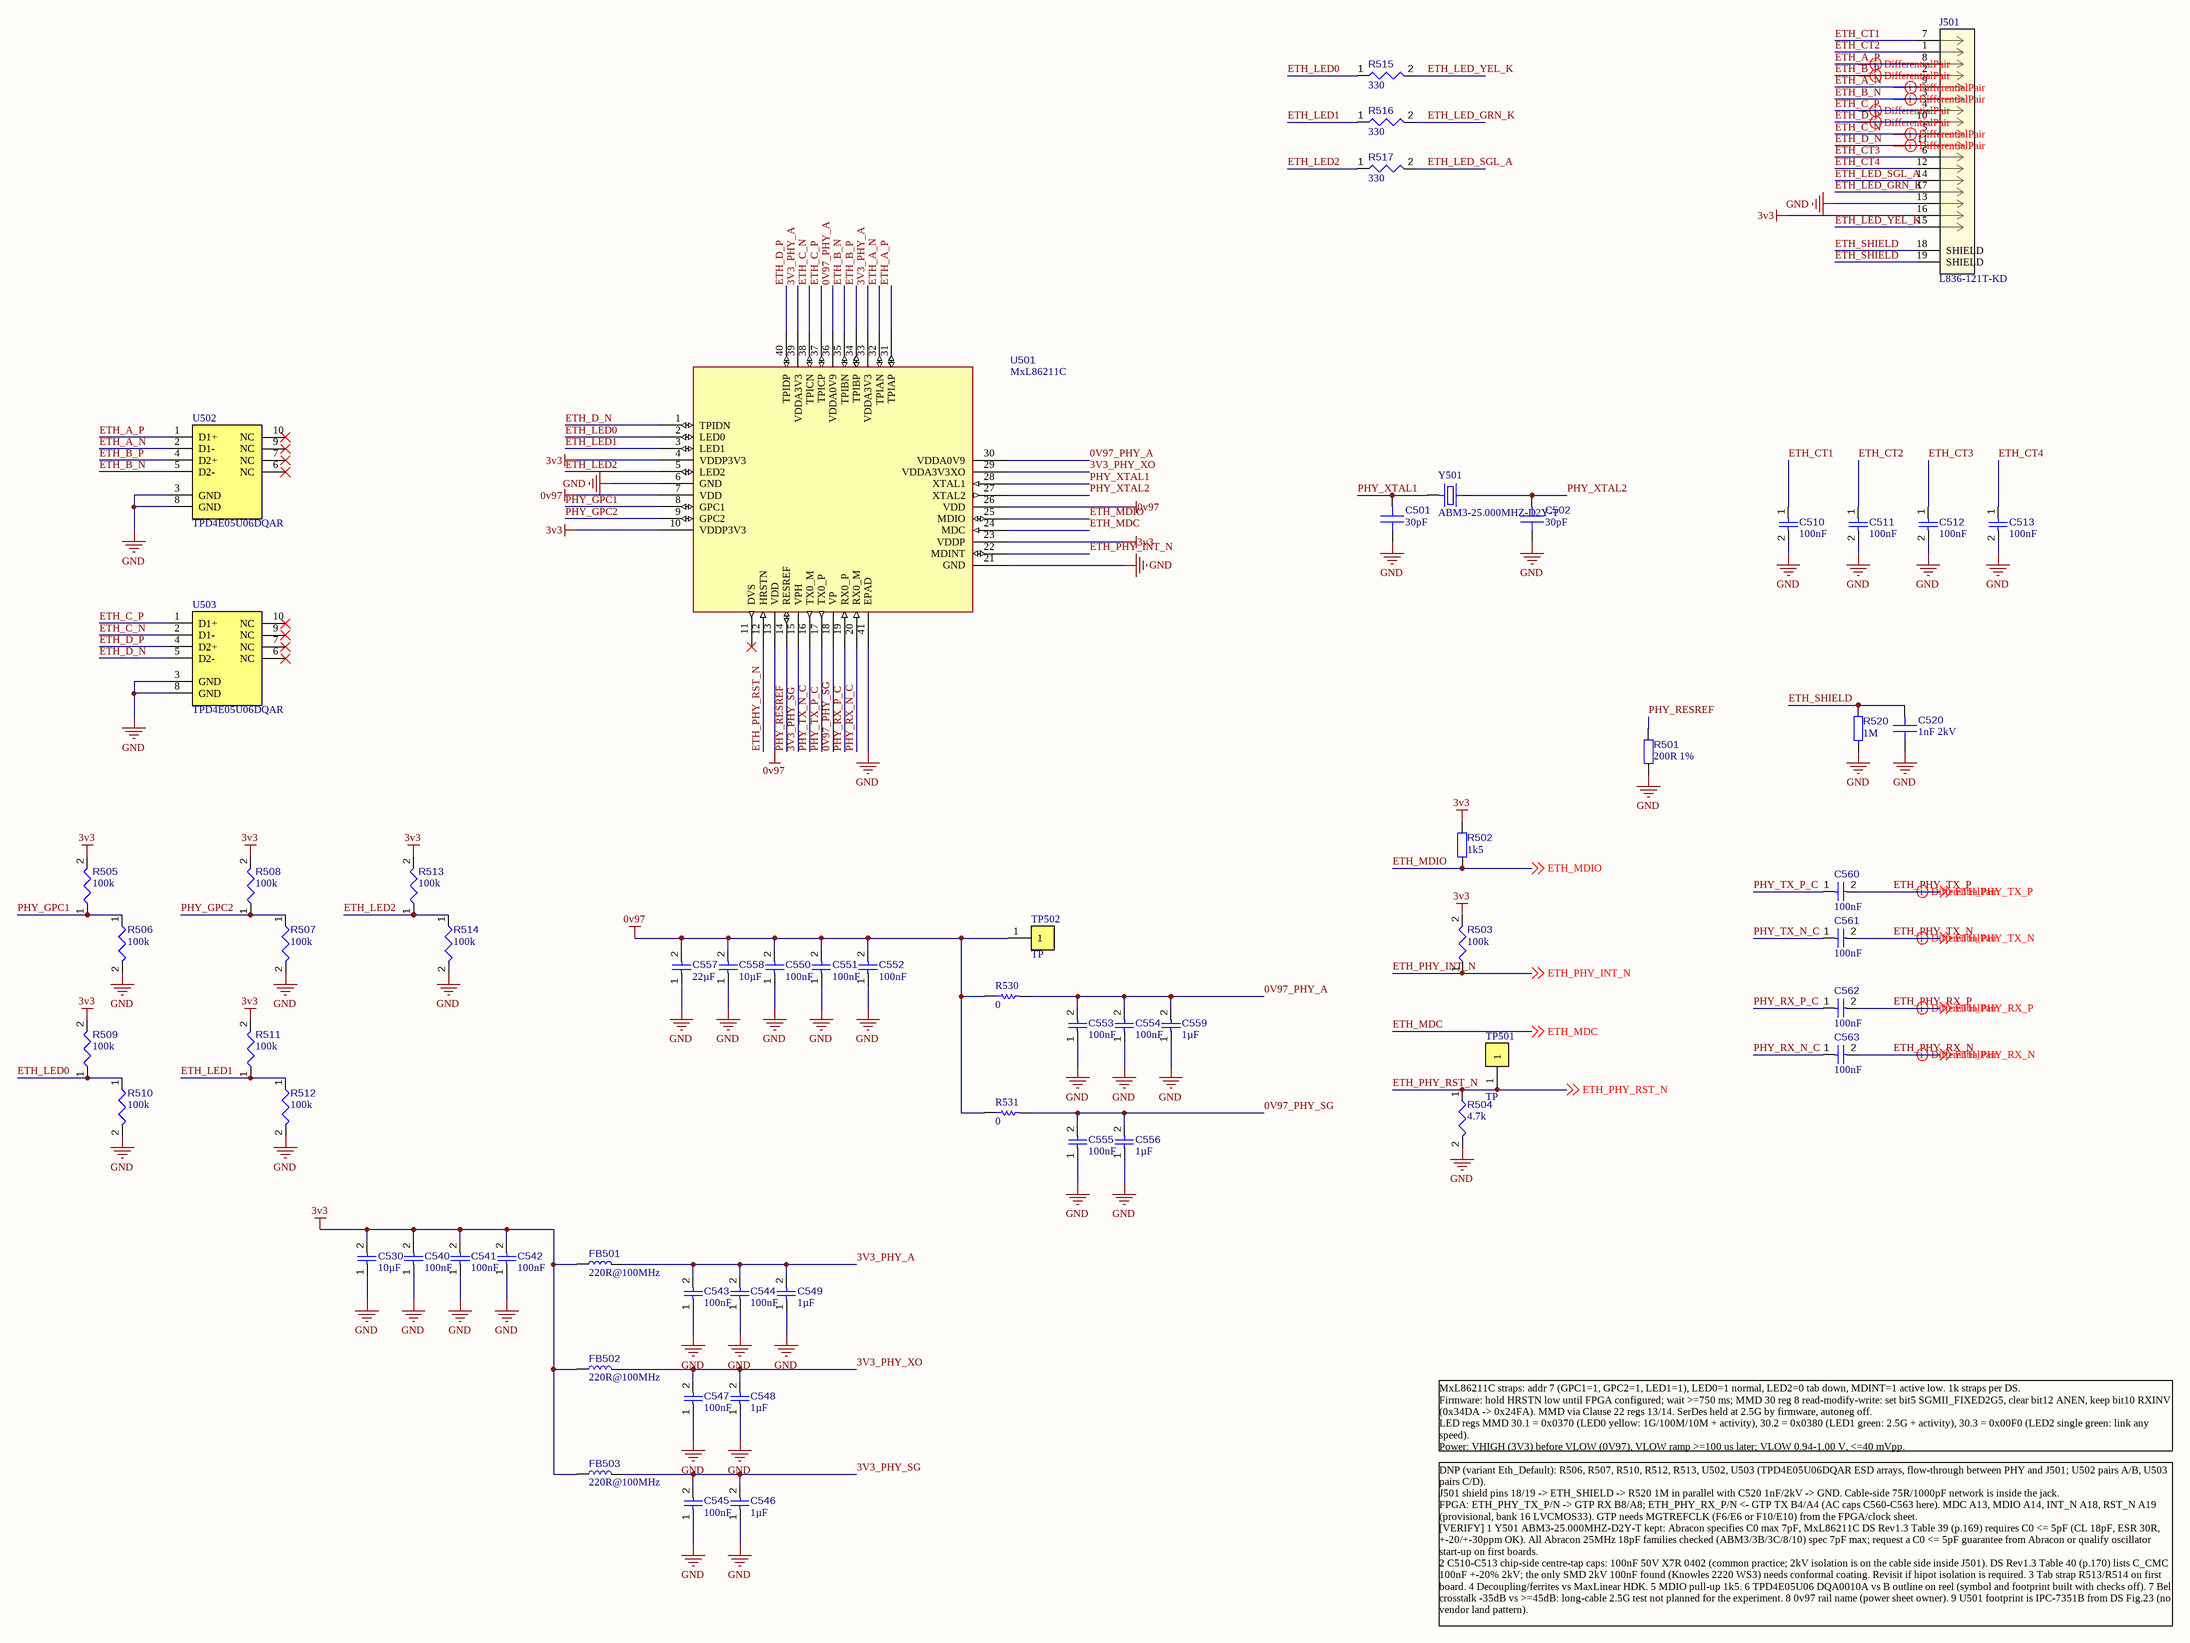
[diagram p3: Eth_2_5Gbe.SchDoc]

### Parts
C501  30pF  [CAPC1005X55N_GRM155]
C502  30pF  [CAPC1005X55N_GRM155]
C510  value 100nF  [CAPC0402(1005)60_L]  (hidden comment: Capacitor 100nF +/-20% 50V 0402)
C511  value 100nF  [CAPC0402(1005)60_L]  (hidden comment: Capacitor 100nF +/-20% 50V 0402)
C512  value 100nF  [CAPC0402(1005)60_L]  (hidden comment: Capacitor 100nF +/-20% 50V 0402)
C513  value 100nF  [CAPC0402(1005)60_L]  (hidden comment: Capacitor 100nF +/-20% 50V 0402)
C520  1nF 2kV  [CAPC3316X180N_AVX1206HV]
C530  value 10µF  [CAPC0603(1608)100_L]  (hidden comment: Capacitor 10µF +/-20% 10V 0603)
C540  value 100nF  [CAPC1005X56X25LL10T15]  (hidden comment: Capacitor 0.1 uF +/- 5% 16 V 0402)
C541  value 100nF  [CAPC1005X56X25LL10T15]  (hidden comment: Capacitor 0.1 uF +/- 5% 16 V 0402)
C542  value 100nF  [CAPC1005X56X25LL10T15]  (hidden comment: Capacitor 0.1 uF +/- 5% 16 V 0402)
C543  value 100nF  [CAPC1005X56X25LL10T15]  (hidden comment: Capacitor 0.1 uF +/- 5% 16 V 0402)
C544  value 100nF  [CAPC1005X56X25LL10T15]  (hidden comment: Capacitor 0.1 uF +/- 5% 16 V 0402)
C545  value 100nF  [CAPC1005X56X25LL10T15]  (hidden comment: Capacitor 0.1 uF +/- 5% 16 V 0402)
C546  value 1µF  [CAPC1005X55X25LL05T10]  (hidden comment: Capacitor 1 uF +/- 10% 6.3 V 0402)
C547  value 100nF  [CAPC1005X56X25LL10T15]  (hidden comment: Capacitor 0.1 uF +/- 5% 16 V 0402)
C548  value 1µF  [CAPC1005X55X25LL05T10]  (hidden comment: Capacitor 1 uF +/- 10% 6.3 V 0402)
C549  value 1µF  [CAPC1005X55X25LL05T10]  (hidden comment: Capacitor 1 uF +/- 10% 6.3 V 0402)
C550  value 100nF  [CAPC1005X56X25LL10T15]  (hidden comment: Capacitor 0.1 uF +/- 5% 16 V 0402)
C551  value 100nF  [CAPC1005X56X25LL10T15]  (hidden comment: Capacitor 0.1 uF +/- 5% 16 V 0402)
C552  value 100nF  [CAPC1005X56X25LL10T15]  (hidden comment: Capacitor 0.1 uF +/- 5% 16 V 0402)
C553  value 100nF  [CAPC1005X56X25LL10T15]  (hidden comment: Capacitor 0.1 uF +/- 5% 16 V 0402)
C554  value 100nF  [CAPC1005X56X25LL10T15]  (hidden comment: Capacitor 0.1 uF +/- 5% 16 V 0402)
C555  value 100nF  [CAPC1005X56X25LL10T15]  (hidden comment: Capacitor 0.1 uF +/- 5% 16 V 0402)
C556  value 1µF  [CAPC1005X55X25LL05T10]  (hidden comment: Capacitor 1 uF +/- 10% 6.3 V 0402)
C557  value 22µF  [CAPC0805(2012)145_L]  (hidden comment: Capacitor 22µF +/-40% 16V 0805)
C558  value 10µF  [CAPC0603(1608)100_L]  (hidden comment: Capacitor 10µF +/-20% 10V 0603)
C559  value 1µF  [CAPC1005X55X25LL05T10]  (hidden comment: Capacitor 1 uF +/- 10% 6.3 V 0402)
C560  value 100nF  [CAPC1005X56X25LL10T15]  (hidden comment: Capacitor 0.1 uF +/- 5% 16 V 0402)
C561  value 100nF  [CAPC1005X56X25LL10T15]  (hidden comment: Capacitor 0.1 uF +/- 5% 16 V 0402)
C562  value 100nF  [CAPC1005X56X25LL10T15]  (hidden comment: Capacitor 0.1 uF +/- 5% 16 V 0402)
C563  value 100nF  [CAPC1005X56X25LL10T15]  (hidden comment: Capacitor 0.1 uF +/- 5% 16 V 0402)
FB501  220R@100MHz  [MURATA_BLM18P_0603]
FB502  220R@100MHz  [MURATA_BLM18P_0603]
FB503  220R@100MHz  [MURATA_BLM18P_0603]
J501  L836-121T-KD  [CONN17_L836-121T-KD_BEL]
R501  200R 1%  [RESC1005X40N_RC0402]
R502  1k5  [RESC1005X40N_RC0402]
R503  value 100k  [RESC1005X40X25ML05T05]  (hidden comment: Resistor 1k +/-1% 0402 63 mW)
R504  value 4.7k  [RESC1005X40X25ML05T05]  (hidden comment: Resistor 4k7 +/-1% 0402 63 mW)
R505  value 100k  [RESC1005X40X25ML05T05]  (hidden comment: Resistor 1k +/-1% 0402 63 mW)
R506  value 100k  [RESC1005X40X25ML05T05]  (hidden comment: Resistor 1k +/-1% 0402 63 mW)
R507  value 100k  [RESC1005X40X25ML05T05]  (hidden comment: Resistor 1k +/-1% 0402 63 mW)
R508  value 100k  [RESC1005X40X25ML05T05]  (hidden comment: Resistor 1k +/-1% 0402 63 mW)
R509  value 100k  [RESC1005X40X25ML05T05]  (hidden comment: Resistor 1k +/-1% 0402 63 mW)
R510  value 100k  [RESC1005X40X25ML05T05]  (hidden comment: Resistor 1k +/-1% 0402 63 mW)
R511  value 100k  [RESC1005X40X25ML05T05]  (hidden comment: Resistor 1k +/-1% 0402 63 mW)
R512  value 100k  [RESC1005X40X25ML05T05]  (hidden comment: Resistor 1k +/-1% 0402 63 mW)
R513  value 100k  [RESC1005X40X25ML05T05]  (hidden comment: Resistor 1k +/-1% 0402 63 mW)
R514  value 100k  [RESC1005X40X25ML05T05]  (hidden comment: Resistor 1k +/-1% 0402 63 mW)
R515  value 330  [RESC0402(1005)_L]  (hidden comment: Resistor 330R +/-5 % 0402 63 mW)
R516  value 330  [RESC0402(1005)_L]  (hidden comment: Resistor 330R +/-5 % 0402 63 mW)
R517  value 330  [RESC0402(1005)_L]  (hidden comment: Resistor 330R +/-5 % 0402 63 mW)
R520  1M  [RESC3216X65N_RC1206]
R530  value 0  [RESC1608X55X25ML10T15]  (hidden comment: Resistor 0R +/- 5% 0603 100 mW)
R531  value 0  [RESC1608X55X25ML10T15]  (hidden comment: Resistor 0R +/- 5% 0603 100 mW)
TP501  TP  [TP_SMD_1R00]
TP502  TP  [TP_SMD_1R00]
U501  MxL86211C  [MXL_VQFN-40_5x5_P0.4_EP3.79]
U502  TPD4E05U06DQAR  [TI_USON-10_DQA0010A]
U503  TPD4E05U06DQAR  [TI_USON-10_DQA0010A]
Y501  ABM3-25.000MHZ-D2Y-T  [ABRACON_ABM3_5.0x3.2]

### Nets
0v97: C550.2 C551.2 C552.2 C557.2 C558.2 R530.1 R531.1 TP502.1 U501.7(VDD) U501.13(VDD) U501.26(VDD)
3v3: C530.2 C540.2 C541.2 C542.2 FB501.1 FB502.1 FB503.1 J501.16 R502.2 R503.2 R505.2 R508.2 R509.2 R511.2 R513.2 U501.4(VDDP3V3) U501.10(VDDP3V3) U501.23(VDDP)
GND: C501.2 C502.2 C510.2 C511.2 C512.2 C513.2 C520.2 C530.1 C540.1 C541.1 C542.1 C543.1 C544.1 C545.1 C546.1 C547.1 C548.1 C549.1 C550.1 C551.1 C552.1 C553.1 C554.1 C555.1 C556.1 C557.1 C558.1 C559.1 J501.13 R501.2 R504.2 R506.2 R507.2 R510.2 R512.2 R514.2 R520.2 U501.6(GND) U501.21(GND) U501.41(EPAD) U502.3(GND) U502.8(GND) U503.3(GND) U503.8(GND)
0V97_PHY_A: C553.2 C554.2 C559.2 R530.2 U501.30(VDDA0V9) U501.36(VDDA0V9)
0V97_PHY_SG: C555.2 C556.2 R531.2 U501.18(VP)
3V3_PHY_A: C543.2 C544.2 C549.2 FB501.2 U501.33(VDDA3V3) U501.39(VDDA3V3)
3V3_PHY_SG: C545.2 C546.2 FB503.2 U501.15(VPH)
3V3_PHY_XO: C547.2 C548.2 FB502.2 U501.29(VDDA3V3XO)
ETH_A_N: J501.9 U501.32(TPIAN) U502.2(D1-)
ETH_A_P: J501.8 U501.31(TPIAP) U502.1(D1+)
ETH_B_N: J501.3 U501.35(TPIBN) U502.5(D2-)
ETH_B_P: J501.2 U501.34(TPIBP) U502.4(D2+)
ETH_C_N: J501.5 U501.38(TPICN) U503.2(D1-)
ETH_C_P: J501.4 U501.37(TPICP) U503.1(D1+)
ETH_CT1: C510.1 J501.7
ETH_CT2: C511.1 J501.1
ETH_CT3: C512.1 J501.6
ETH_CT4: C513.1 J501.12
ETH_D_N: J501.11 U501.1(TPIDN) U503.5(D2-)
ETH_D_P: J501.10 U501.40(TPIDP) U503.4(D2+)
ETH_LED0: R509.1 R510.1 R515.1 U501.2(LED0)
ETH_LED1: R511.1 R512.1 R516.1 U501.3(LED1)
ETH_LED2: R513.1 R514.1 R517.1 U501.5(LED2)
ETH_LED_GRN_K: J501.17 R516.2
ETH_LED_SGL_A: J501.14 R517.2
ETH_LED_YEL_K: J501.15 R515.2
ETH_MDC: U501.24(MDC) ; off-sheet ETH_MDC
ETH_MDIO: R502.1 U501.25(MDIO) ; off-sheet ETH_MDIO
ETH_PHY_INT_N: R503.1 U501.22(MDINT) ; off-sheet ETH_PHY_INT_N
ETH_PHY_RST_N: R504.1 TP501.1 U501.12(HRSTN) ; off-sheet ETH_PHY_RST_N
ETH_PHY_RX_N: C563.2 ; off-sheet ETH_PHY_RX_N
ETH_PHY_RX_P: C562.2 ; off-sheet ETH_PHY_RX_P
ETH_PHY_TX_N: C561.2 ; off-sheet ETH_PHY_TX_N
ETH_PHY_TX_P: C560.2 ; off-sheet ETH_PHY_TX_P
ETH_SHIELD: C520.1 J501.18(SHIELD) J501.19(SHIELD) R520.1
PHY_GPC1: R505.1 R506.1 U501.8(GPC1)
PHY_GPC2: R507.1 R508.1 U501.9(GPC2)
PHY_RESREF: R501.1 U501.14(RESREF)
PHY_RX_N_C: C563.1 U501.20(RX0_M)
PHY_RX_P_C: C562.1 U501.19(RX0_P)
PHY_TX_N_C: C561.1 U501.16(TX0_M)
PHY_TX_P_C: C560.1 U501.17(TX0_P)
PHY_XTAL1: C501.1 U501.28(XTAL1) Y501.1
PHY_XTAL2: C502.1 U501.27(XTAL2) Y501.2

Not connected (* = marked no-connect by the designer): U501 11(DVS)*; U502 6(NC)* 7(NC)* 9(NC)* 10(NC)*; U503 6(NC)* 7(NC)* 9(NC)* 10(NC)*

### Layout directives
differential pair: ETH_A_N, ETH_A_P, ETH_B_N, ETH_B_P, ETH_C_N, ETH_C_P, ETH_D_N, ETH_D_P, ETH_PHY_RX_N, ETH_PHY_RX_P, ETH_PHY_TX_N, ETH_PHY_TX_P

### Notes on the sheet
- MxL86211C straps: addr 7 (GPC1=1, GPC2=1, LED1=1), LED0=1 normal, LED2=0 tab down, MDINT=1 active low. 1k straps per DS.
  Firmware: hold HRSTN low until FPGA configured; wait >=750 ms; MMD 30 reg 8 read-modify-write: set bit5 SGMII_FIXED2G5, clear bit12 ANEN, keep bit10 RXINV (0x34DA -> 0x24FA). MMD via Clause 22 regs 13/14. SerDes held at 2.5G by firmware, autoneg off.
  LED regs MMD 30.1 = 0x0370 (LED0 yellow: 1G/100M/10M + activity), 30.2 = 0x0380 (LED1 green: 2.5G + activity), 30.3 = 0x00F0 (LED2 single green: link any speed).
  Power: VHIGH (3V3) before VLOW (0V97), VLOW ramp >=100 us later; VLOW 0.94-1.00 V, <=40 mVpp.
- DNP (variant Eth_Default): R506, R507, R510, R512, R513, U502, U503 (TPD4E05U06DQAR ESD arrays, flow-through between PHY and J501; U502 pairs A/B, U503 pairs C/D).
  J501 shield pins 18/19 -> ETH_SHIELD -> R520 1M in parallel with C520 1nF/2kV -> GND. Cable-side 75R/1000pF network is inside the jack.
  FPGA: ETH_PHY_TX_P/N -> GTP RX B8/A8; ETH_PHY_RX_P/N <- GTP TX B4/A4 (AC caps C560-C563 here). MDC A13, MDIO A14, INT_N A18, RST_N A19 (provisional, bank 16 LVCMOS33). GTP needs MGTREFCLK (F6/E6 or F10/E10) from the FPGA/clock sheet.
  [VERIFY] 1 Y501 ABM3-25.000MHZ-D2Y-T kept: Abracon specifies C0 max 7pF, MxL86211C DS Rev1.3 Table 39 (p.169) requires C0 <= 5pF (CL 18pF, ESR 30R, +-20/+-30ppm OK). All Abracon 25MHz 18pF families checked (ABM3/3B/3C/8/10) spec 7pF max; request a C0 <= 5pF guarantee from Abracon or qualify oscillator start-up on first boards.
  2 C510-C513 chip-side centre-tap caps: 100nF 50V X7R 0402 (common practice; 2kV isolation is on the cable side inside J501). DS Rev1.3 Table 40 (p.170) lists C_CMC 100nF +-20% 2kV; the only SMD 2kV 100nF found (Knowles 2220 WS3) needs conformal coating. Revisit if hipot isolation is required. 3 Tab strap R513/R514 on first board. 4 Decoupling/ferrites vs MaxLinear HDK. 5 MDIO pull-up 1k5. 6 TPD4E05U06 DQA0010A vs B outline on reel (symbol and footprint built with checks off). 7 Bel crosstalk -35dB vs >=45dB: long-cable 2.5G test not planned for the experiment. 8 0v97 rail name (power sheet owner). 9 U501 footprint is IPC-7351B from DS Fig.23 (no vendor land pattern).

### Library data of the parts
C501 C502 = CAP_0402: 30pF C0G 50V 0402; Manufacturer: Murata; Manufacturer Part Number: GRM1555C1H300JA01D
C510-C513 = CMP-001-00067-3: Chip Capacitor, 100nF +/-20%, 50V, 0402, Thickness 0.6 mm; Tolerance: 10%; Min Operating Temperature: -55°C; Pins: 2; Case/Package: 0402; Max Operating Temperature: 85°C; Voltage Rating: 50V; Mounting Technology: SMT
C520 = CAP_1206HV: 1nF 2kV X7R 1206; Manufacturer: KYOCERA AVX; Manufacturer Part Number: 1206GC102KAT2A; VERIFY: AVX HV note: may need surface coating to prevent external arcing
C530 C558 = CMP-001-00075-4: Chip Capacitor, 10µF +/-20%, 10V, 0603, Thickness 1 mm; Tolerance: 10%; Voltage Rating: 10V; Max Operating Temperature: 85°C; Pins: 2; Case/Package: 0603; Mounting Technology: SMT; Min Operating Temperature: -55°C
C540-C545 C547 C550-C555 C560-C563 = CMP-001-00001-6: Chip Capacitor, 0.1 uF, +/- 5%, 16 V, 0402 (1005 Metric); Capacitor Type: Ceramic; Voltage Rating: 16V; Max Operating Temperature: 125°C; Min Operating Temperature: -55°C; Case/Package: 0402; Mounting Technology: SM; Pins: 2; Tolerance: 5%; RoHS Compliant: True
C546 C548 C549 C556 C559 = CMP-001-00008-6: Chip Capacitor, 1 uF, +/- 10%, 6.3 V, 0402 (1005 Metric); Capacitor Type: Ceramic; Voltage Rating: 6.3V; Max Operating Temperature: 85°C; Mounting Technology: SM; Tolerance: 10%; Case/Package: 0402; RoHS Compliant: True; Min Operating Temperature: -55°C; Pins: 2
C557 = CMP-001-00081-4: Chip Capacitor, 22µF +/-40%, 16V, 0805, Thickness 1.45 mm; Tolerance: 5%; Voltage Rating: 16V; Mounting Technology: SMT; Pins: 2; Max Operating Temperature: 85°C; Case/Package: 0805; Min Operating Temperature: -55°C
FB501-FB503 = FERRITE: Ferrite 220R@100MHz 0603, 1.4A @85C, 0.14R max; Manufacturer: Murata; Manufacturer Part Number: BLM18PG221SN1D
J501 = L836-121T-KD: No Description Available; Manufacturer_Name: Belfuse; Manufacturer: Bel; Copyright: Copyright (C) 2026 Ultra Librarian. All rights reserved.; Manufacturer_Part_Number: L836-121T-KD; RefDes: RefDes; Type: Type; Manufacturer Part Number: L836-121T-KD
R501 = RES_0402: 200R 1% 0402; Manufacturer: Yageo; Manufacturer Part Number: RC0402FR-07200RL
R502 = RES_0402: 1k5 1% 0402; Manufacturer: Yageo; Manufacturer Part Number: RC0402FR-071K5L; VERIFY: MDIO pull-up value, DS gives none
R503 R505-R514 = CMP-009-00012-5: Chip Resistor, 1 KOhm, +/- 1%, 63 mW, -55 to 155 degC, 0402 (1005 Metric); Power: 63mW; Max Operating Temperature: 155°C; Min Operating Temperature: -55°C; Case/Package: 0402; Pins: 2; RoHS Compliant: True; Tolerance: 1%; Mounting Technology: SM
R504 = CMP-009-00034-5: Chip Resistor, 4.7 KOhm, +/- 1%, 63 mW, -55 to 155 degC, 0402 (1005 Metric); Power: 63mW; Voltage Rating: 50V; Case/Package: 0402; Tolerance: 1%; Max Operating Temperature: 155°C; Pins: 2; RoHS Compliant: True; Min Operating Temperature: -55°C; Mounting Technology: SM
R515-R517 = CMP-009-00132-3: Chip Resistor, 330 Ohms, +/-5 %, 63 mW, -55 to 155 degC, 0402; Power: 63mW; Tolerance: 5%; Pins: 2; Max Operating Temperature: 155°C; Min Operating Temperature: -55°C; Case/Package: 0402
R520 = RES_1206: 1M 1% 1206; Manufacturer: Yageo; Manufacturer Part Number: RC1206FR-071ML
R530 R531 = CMP-009-00006-5: Chip Resistor, 0 Ohm, 0.1 W, -55 to 155 degC, 0603 (1608 Metric); Power: 100mW; Voltage Rating: 50V; Max Operating Temperature: 155°C; RoHS Compliant: True; Mounting Technology: SM; Case/Package: 0603; Min Operating Temperature: -55°C; Tolerance: 5%; Pins: 2
TP501 = TESTPOINT: Test point HRSTN
TP502 = TESTPOINT: Test point 0V97
U501 = MxL86211C: 2.5GBASE-T PHY, PG-VQFN-40 5x5; Manufacturer: MaxLinear; Manufacturer Part Number: MXL86211C-AQB-T
U502 = TPD4E05U06DQAR: 4-ch ESD, 0.42-0.5pF typ, USON-10, DNP. Pairs A/B; Manufacturer: Texas Instruments; VERIFY: DQA0010A vs B outline on reel, place flow-through between PHY and J501; Manufacturer Part Number: TPD4E05U06DQAR
U503 = TPD4E05U06DQAR: 4-ch ESD, 0.42-0.5pF typ, USON-10, DNP. Pairs C/D; Manufacturer: Texas Instruments; VERIFY: DQA0010A vs B outline on reel, place flow-through between PHY and J501; Manufacturer Part Number: TPD4E05U06DQAR
Y501 = XTAL2P: Crystal, 2 pad; Manufacturer: Abracon; VERIFY: FAILS DS Table 39: C0 max 7pF (ABM3 rev 04-25-22 p.1) vs <=5pF required. CL 18pF, ESR 30R, +-20/+-30ppm OK; Manufacturer Part Number: ABM3-25.000MHZ-D2Y-T

## Nets that join several sheets
3v3: Sheet2 (8 pins), Eth_2_5Gbe (18 pins)
5V: Sheet1 (C8.1 L1.2 R1.2), Sheet2 (21 pins)
GND: Sheet1 (28 pins), Sheet2 (35 pins), Sheet3 (35 pins), Eth_2_5Gbe (44 pins)
Main_clk: Sheet1 (U1.27), Sheet2 (C19.2 C30.2 C41.2)

## Assembly variants
Eth_Default: not fitted R506 R506 R507 R507 R510 R510 R512 R512 R513 R513 U502 U502 U503